# Altium schematic sheet Opamp-Sheet1.SchDoc
size A4; SheetNumber: 6; SheetTotal: 11
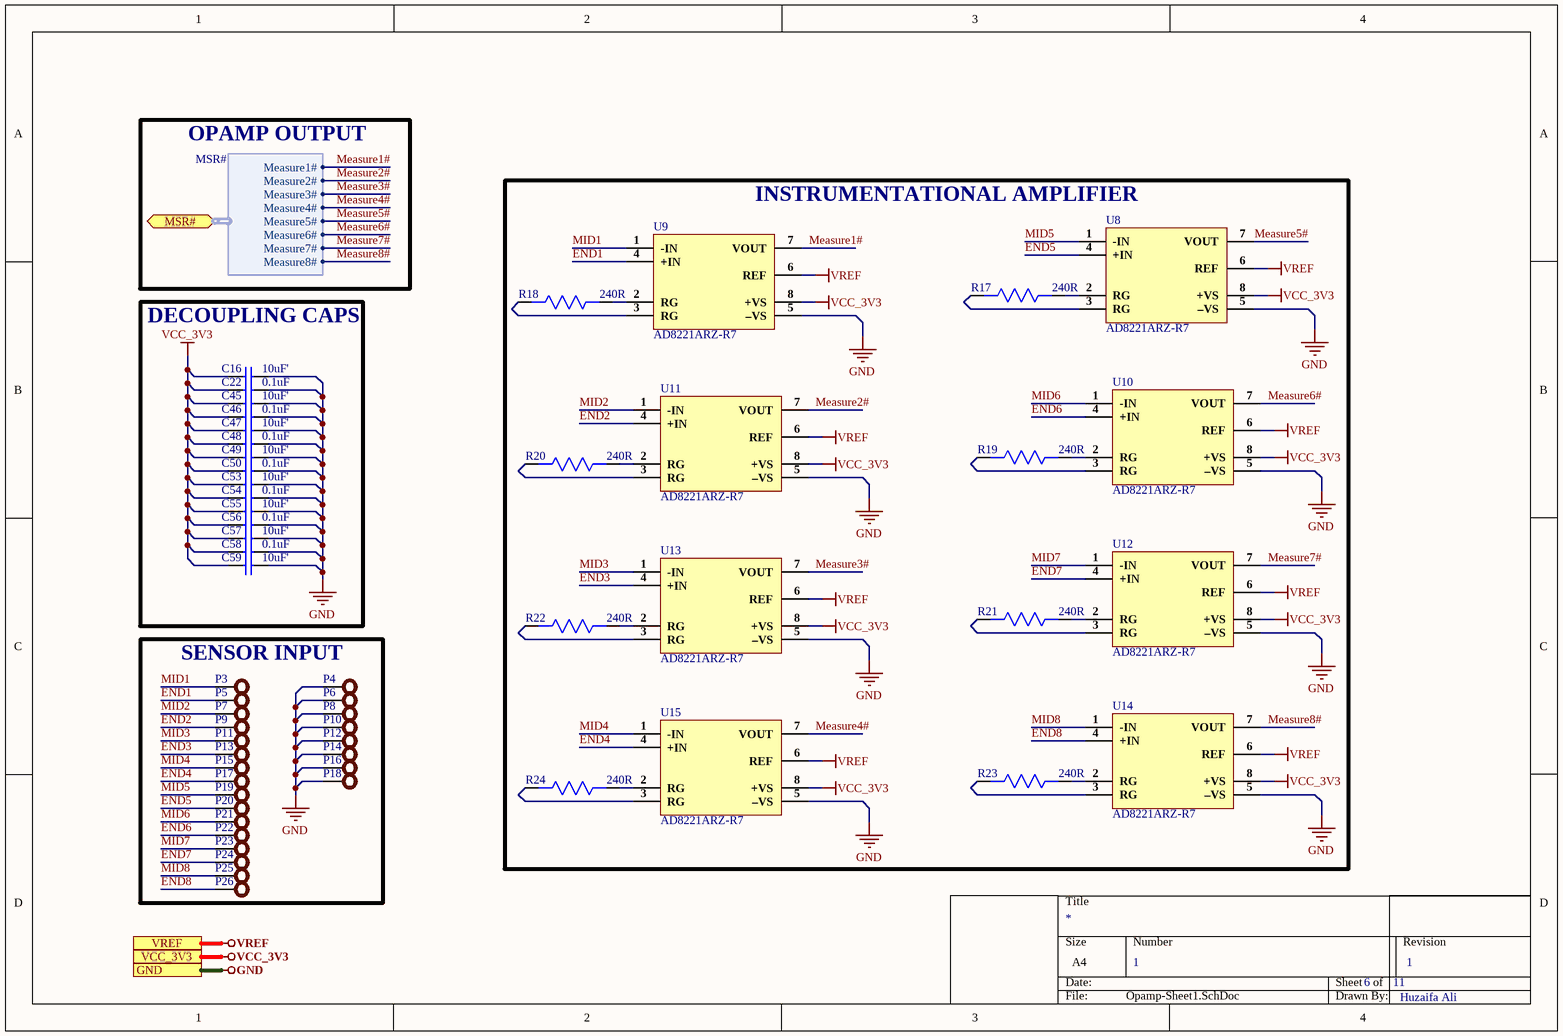
[diagram p0: Opamp-Sheet1.SchDoc]

## Parts
C16  10uF'  [Cap0603]
C22  0.1uF  [Cap 0402]
C45  10uF'  [Cap0603]
C46  0.1uF  [Cap 0402]
C47  10uF'  [Cap0603]
C48  0.1uF  [Cap 0402]
C49  10uF'  [Cap0603]
C50  0.1uF  [Cap 0402]
C53  10uF'  [Cap0603]
C54  0.1uF  [Cap 0402]
C55  10uF'  [Cap0603]
C56  0.1uF  [Cap 0402]
C57  10uF'  [Cap0603]
C58  0.1uF  [Cap 0402]
C59  10uF'  [Cap0603]
P3  Test Point  [TEST POINT]  (value not drawn)
P4  Test Point  [TEST POINT]  (value not drawn)
P5  Test Point  [TEST POINT]  (value not drawn)
P6  Test Point  [TEST POINT]  (value not drawn)
P7  Test Point  [TEST POINT]  (value not drawn)
P8  Test Point  [TEST POINT]  (value not drawn)
P9  Test Point  [TEST POINT]  (value not drawn)
P10  Test Point  [TEST POINT]  (value not drawn)
P11  Test Point  [TEST POINT]  (value not drawn)
P12  Test Point  [TEST POINT]  (value not drawn)
P13  Test Point  [TEST POINT]  (value not drawn)
P14  Test Point  [TEST POINT]  (value not drawn)
P15  Test Point  [TEST POINT]  (value not drawn)
P16  Test Point  [TEST POINT]  (value not drawn)
P17  Test Point  [TEST POINT]  (value not drawn)
P18  Test Point  [TEST POINT]  (value not drawn)
P19  Test Point  [TEST POINT]  (value not drawn)
P20  Test Point  [TEST POINT]  (value not drawn)
P21  Test Point  [TEST POINT]  (value not drawn)
P22  Test Point  [TEST POINT]  (value not drawn)
P23  Test Point  [TEST POINT]  (value not drawn)
P24  Test Point  [TEST POINT]  (value not drawn)
P25  Test Point  [TEST POINT]  (value not drawn)
P26  Test Point  [TEST POINT]  (value not drawn)
R17  240R  [Res0402]
R18  240R  [Res0402]
R19  240R  [Res0402]
R20  240R  [Res0402]
R21  240R  [Res0402]
R22  240R  [Res0402]
R23  240R  [Res0402]
R24  240R  [Res0402]
U8  AD8221ARZ-R7  [SOIC-8]
U9  AD8221ARZ-R7  [SOIC-8]
U10  AD8221ARZ-R7  [SOIC-8]
U11  AD8221ARZ-R7  [SOIC-8]
U12  AD8221ARZ-R7  [SOIC-8]
U13  AD8221ARZ-R7  [SOIC-8]
U14  AD8221ARZ-R7  [SOIC-8]
U15  AD8221ARZ-R7  [SOIC-8]

## Blocks framed on the sheet
INSTRUMENTATIONAL AMPLIFIER: R17-R24 U8-U15
DECOUPLING CAPS: C16 C22 C45-C50 C53-C59
SENSOR INPUT: P3-P26

## Ports
GND, MSR# (bidir, harness MSR#), VCC_3V3, VREF

## Harnesses
MSR#: Measure1#, Measure2#, Measure3#, Measure4#, Measure5#, Measure6#, Measure7#, Measure8#

## Nets
GND: C16.2 C22.2 C45.2 C46.2 C47.2 C48.2 C49.2 C50.2 C53.2 C54.2 C55.2 C56.2 C57.2 C58.2 C59.2 P4.1 P6.1 P8.1 P10.1 P12.1 P14.1 P16.1 P18.1 U8.5(–VS) U9.5(–VS) U10.5(–VS) U11.5(–VS) U12.5(–VS) U13.5(–VS) U14.5(–VS) U15.5(–VS) ; port GND
VCC_3V3: C16.1 C22.1 C45.1 C46.1 C47.1 C48.1 C49.1 C50.1 C53.1 C54.1 C55.1 C56.1 C57.1 C58.1 C59.1 U8.8(+VS) U9.8(+VS) U10.8(+VS) U11.8(+VS) U12.8(+VS) U13.8(+VS) U14.8(+VS) U15.8(+VS) ; port VCC_3V3
VREF: U8.6(REF) U9.6(REF) U10.6(REF) U11.6(REF) U12.6(REF) U13.6(REF) U14.6(REF) U15.6(REF) ; port VREF
END1: P5.1 U9.4(+IN)
END2: P9.1 U11.4(+IN)
END3: P13.1 U13.4(+IN)
END4: P17.1 U15.4(+IN)
END5: P20.1 U8.4(+IN)
END6: P22.1 U10.4(+IN)
END7: P24.1 U12.4(+IN)
END8: P26.1 U14.4(+IN)
Measure1#: U9.7(VOUT) ; port MSR#.Measure1#
Measure2#: U11.7(VOUT) ; port MSR#.Measure2#
Measure3#: U13.7(VOUT) ; port MSR#.Measure3#
Measure4#: U15.7(VOUT) ; port MSR#.Measure4#
Measure5#: U8.7(VOUT) ; port MSR#.Measure5#
Measure6#: U10.7(VOUT) ; port MSR#.Measure6#
Measure7#: U12.7(VOUT) ; port MSR#.Measure7#
Measure8#: U14.7(VOUT) ; port MSR#.Measure8#
MID1: P3.1 U9.1(-IN)
MID2: P7.1 U11.1(-IN)
MID3: P11.1 U13.1(-IN)
MID4: P15.1 U15.1(-IN)
MID5: P19.1 U8.1(-IN)
MID6: P21.1 U10.1(-IN)
MID7: P23.1 U12.1(-IN)
MID8: P25.1 U14.1(-IN)
NetR17_1: R17.1 U8.2(RG)
NetR17_2: R17.2 U8.3(RG)
NetR18_1: R18.1 U9.2(RG)
NetR18_2: R18.2 U9.3(RG)
NetR19_1: R19.1 U10.2(RG)
NetR19_2: R19.2 U10.3(RG)
NetR20_1: R20.1 U11.2(RG)
NetR20_2: R20.2 U11.3(RG)
NetR21_1: R21.1 U12.2(RG)
NetR21_2: R21.2 U12.3(RG)
NetR22_1: R22.1 U13.2(RG)
NetR22_2: R22.2 U13.3(RG)
NetR23_1: R23.1 U14.2(RG)
NetR23_2: R23.2 U14.3(RG)
NetR24_1: R24.1 U15.2(RG)
NetR24_2: R24.2 U15.3(RG)

## Notes on the sheet
- OPAMP OUTPUT
- 1
- Huzaifa Ali

## Library data of the parts
C16 C45 C47 C49 C53 C55 C57 C59 = CL10A106MA8NRNC: CAP CER 10UF 25V X5R 0603; Manufacturer: Samsung; Tolerance: 20%; Supplier 1: Avnet; Manufacturer Part Number: CL10A106MA8NRNC; RoHS: Yes; Category: Ceramic Capacitors; Pricing 1: 4000=0.03753, 8000=0.03700, 16000=0.03595, 24000=0.03515, 32000=0.03383, 40000=0.03304, 400000=0.03225 (USD); Mount: Surface Mount; Case/Package: 0603; Case Code (Metric): 1608; Case Code (Imperial): 0603; Contact Plating: Tin; Min Operating Temperature: -55°C; Max Operating Temperature: 85°C; Package Quantity: 1; Packaging: Tape and Reel; Capacitance: 10uF; Voltage Rating: 25V; Dielectric: X5R; Termination: Wraparound; Series: CL; Construction: Flat; Length: 0.063inch; Width: 0.031inch; Thickness: 0.035inch; Lead Free: Lead Free; RoHS Compliant: Yes; ComponentLink1URL: https://datasheet.ciiva.com/25766/cl10a106ma8nrnc-25766562.pdf?src-supplier=Digi-Key; ComponentLink1Description: https://datasheet.ciiva.com/25766/cl10a106ma8nrnc-25766562.pdf?src-supplier=Digi-Key; Supplier Part Number 1: CL10A106MA8NRNC
C22 C46 C48 C50 C54 C56 C58 = GRM155R71H104ME14D: CAP CER 0.1UF 50V X7R 0402; Manufacturer: Murata; Tolerance: 20%; Capacitance: 100nF; Supplier 1: Digi-Key; Manufacturer Part Number: GRM155R71H104ME14D; Stock 1: 439844; Pricing 1: 1=0.1, 10=0.038, 100=0.0168, 500=0.01198, 1000=0.00941, 2500=0.00855, 5000=0.00787 (USD); Mount: Surface Mount; Case/Package: 0402; Min Operating Temperature: -55°C; Max Operating Temperature: 125°C; Packaging: Cut Tape; Voltage Rating: 50V; Length: 0.039inch; Width: 0.02inch; Thickness: 0.022inch; ComponentLink1URL: http://search.murata.co.jp/Ceramy/image/img/A01X/G101/ENG/GRM155R71H104ME14-01.pdf?src-supplier=Digi-Key; ComponentLink1Description: http://search.murata.co.jp/Ceramy/image/img/A01X/G101/ENG/GRM155R71H104ME14-01.pdf?src-supplier=Digi-Key; ComponentLink2URL: http://psearch.en.murata.com/capacitor/product/GRM155R71H104ME14%23.pdf?src-supplier=Avnet; ComponentLink2Description: http://psearch.en.murata.com/capacitor/product/GRM155R71H104ME14%23.pdf?src-supplier=Avnet; ComponentLink3URL: http://components.arrow.com/part/dataview/0323_07177683?src-supplier=Arrow+Europe; ComponentLink3Description: http://components.arrow.com/part/dataview/0323_07177683?src-supplier=Arrow+Europe; ComponentLink4URL: http://www.mouser.com/ds/2/281/c02e-2905.pdf?src-supplier=Mouser; ComponentLink4Description: http://www.mouser.com/ds/2/281/c02e-2905.pdf?src-supplier=Mouser; Supplier Part Number 1: 490-10701-1-ND
P3-P26 = TEST POINT: Test Point ON
R17-R24 = RC0402FR-07240RL: RES SMD 0402 240 Ohm 1% 1/16W ±100ppm/°C Molded SMD Paper T/R; Manufacturer: Yageo; Power Rating: 63mW; Voltage Rating (DC): 50V; Supplier 1: Arrow Electronics; Manufacturer Part Number: RC0402FR-07240RL; RoHS: Yes; Category: Chip SMD Resistors; Stock 1: 3138480; Pricing 1: 10000=0.00190 (USD); Case/Package: 0402; Case Code (Metric): 1005; Case Code (Imperial): 0402; Size Code: 0402; Min Operating Temperature: -55°C; Max Operating Temperature: 155°C; Resistance: 240R; Tolerance: 1%; Packaging: Tape and Reel; Resistor Type: Thick Film; Temperature Coefficient: 100ppm/°C; Voltage Rating: 50V; Package Quantity: 1; Number of Terminations: 2; Termination: SMD/SMT; Max Power Dissipation: 63mW; Features: Moisture Resistant; Series: RC; Construction: Rectangular; Resistance Tolerance: 1%; Length: 1mm; Width: 0.02inch; Height: 0.016inch; Depth: 0.5mm; REACH SVHC: Unknown; Lead Free: Lead Free; RoHS Compliant: Yes; Military Standard: Not; ComponentLink1URL: https://datasheet.ciiva.com/7849/1018594-7849915.pdf?src-supplier=Element14; ComponentLink1Description: https://datasheet.ciiva.com/7849/1018594-7849915.pdf?src-supplier=Element14; ComponentLink2URL: https://datasheet.ciiva.com/7849/1018594-7849916.pdf?src-supplier=Element14; ComponentLink2Description: https://datasheet.ciiva.com/7849/1018594-7849916.pdf?src-supplier=Element14; ComponentLink3URL: https://datasheet.ciiva.com/2519/pyu-r-int-thick-7-2519157.pdf?src-supplier=Digi-Key; ComponentLink3Description: https://datasheet.ciiva.com/2519/pyu-r-int-thick-7-2519157.pdf?src-supplier=Digi-Key; ComponentLink4URL: https://datasheet.ciiva.com/2519/pyu-r-int-thick-7-2519158.pdf?src-supplier=Digi-Key; ComponentLink4Description: https://datasheet.ciiva.com/2519/pyu-r-int-thick-7-2519158.pdf?src-supplier=Digi-Key; ComponentLink5URL: https://datasheet.ciiva.com/2519/pyu-r-int-thick-7-2519156.pdf?src-supplier=Digi-Key; ComponentLink5Description: https://datasheet.ciiva.com/2519/pyu-r-int-thick-7-2519156.pdf?src-supplier=Digi-Key; ComponentLink6URL: https://datasheet.ciiva.com/12669/pyu-rc0402-51-rohs-l-6-r-12669689.pdf?src-supplier=Mouser; ComponentLink6Description: https://datasheet.ciiva.com/12669/pyu-rc0402-51-rohs-l-6-r-12669689.pdf?src-supplier=Mouser; ComponentLink7URL: https://datasheet.ciiva.com/17419/pyu-rc0402-51-rohs-l-6-r-17419482.pdf?src-supplier=Future+Electronics; ComponentLink7Description: https://datasheet.ciiva.com/17419/pyu-rc0402-51-rohs-l-6-r-17419482.pdf?src-supplier=Future+Electronics; Supplier Part Number 1: RC0402FR-07240RL
U8-U15 = AD8221ARZ-R7: IC OPAMP INSTR 825KHZ 8SOIC; Manufacturer: Analog Devices; Number of Channels: 1; Common Mode Rejection Ratio: 80dB; Min Dual Supply Voltage: 2.3V; Max Dual Supply Voltage: 18V; Slew Rate: 2.5V/µs; Nominal Supply Current: 1mA; Max Power Dissipation: 200mW; Bandwidth: 562kHz; Input Bias Current: 1.5nA; Input Offset Voltage (Vos): 60uV; Output Current per Channel: 18mA; Power Supply Rejection Ratio (PSRR): 130dB; Voltage Gain: 60dB; Input Resistance: 100GR; Quiescent Current: 900uA; Operating Supply Voltage: 36V; Supplier 1: Mouser; Manufacturer Part Number: AD8221ARZ-R7; RoHS: Yes; Category: Amplifiers - Op Amps, Buffer, Instrumentation; Pricing 1: 1=7.37000, 10=6.66000, 25=6.35000, 50=6.35000, 100=5.51000, 250=5.27000, 500=4.80000, 1000=4.37000, 10000=4.37000 (USD); Case/Package: SOIC; Number of Pins: 8; Contact Plating: Tin,Matte; Min Operating Temperature: -40°C; Max Operating Temperature: 85°C; -3db Bandwidth: 825kHz; Package Quantity: 1000; Packaging: Tape and Reel; Number of Circuits: 1; Operating Supply Current: 1mA; Number of Elements: 1; Power Dissipation: 200mW; Series: -; Supply Current: 1mA; Radiation Hardening: No; Lead Free: Contains Lead; RoHS Compliant: Yes; ComponentLink1URL: https://datasheet.ciiva.com/15128/getdatasheetpartid-313520-15128733.pdf?src-supplier=Verical; ComponentLink1Description: https://datasheet.ciiva.com/15128/getdatasheetpartid-313520-15128733.pdf?src-supplier=Verical; ComponentLink2URL: https://datasheet.ciiva.com/2975/ad8221-2975658.pdf?src-supplier=Avnet; ComponentLink2Description: https://datasheet.ciiva.com/2975/ad8221-2975658.pdf?src-supplier=Avnet; ComponentLink3URL: https://datasheet.ciiva.com/2975/ad8221-2975980.pdf?src-supplier=Avnet; ComponentLink3Description: https://datasheet.ciiva.com/2975/ad8221-2975980.pdf?src-supplier=Avnet; ComponentLink4URL: https://datasheet.ciiva.com/6628/ad8221-6628618.pdf?src-supplier=Digi-Key; ComponentLink4Description: https://datasheet.ciiva.com/6628/ad8221-6628618.pdf?src-supplier=Digi-Key; ComponentLink5URL: https://datasheet.ciiva.com/6628/ad8221-6628619.pdf?src-supplier=Digi-Key; ComponentLink5Description: https://datasheet.ciiva.com/6628/ad8221-6628619.pdf?src-supplier=Digi-Key; ComponentLink6URL: https://datasheet.ciiva.com/6628/ad8221-6628617.pdf?src-supplier=Digi-Key; ComponentLink6Description: https://datasheet.ciiva.com/6628/ad8221-6628617.pdf?src-supplier=Digi-Key; ComponentLink7URL: https://datasheet.ciiva.com/48709/001249009-da-01-en-ic-amp-inst-prec-ad8221arz-r7-soic-8-adi-48709526.pdf?src-supplier=Conrad; ComponentLink7Description: https://datasheet.ciiva.com/48709/001249009-da-01-en-ic-amp-inst-prec-ad8221arz-r7-soic-8-adi-48709526.pdf?src-supplier=Conrad; Supplier Part Number 1: 584-AD8221ARZ-R7